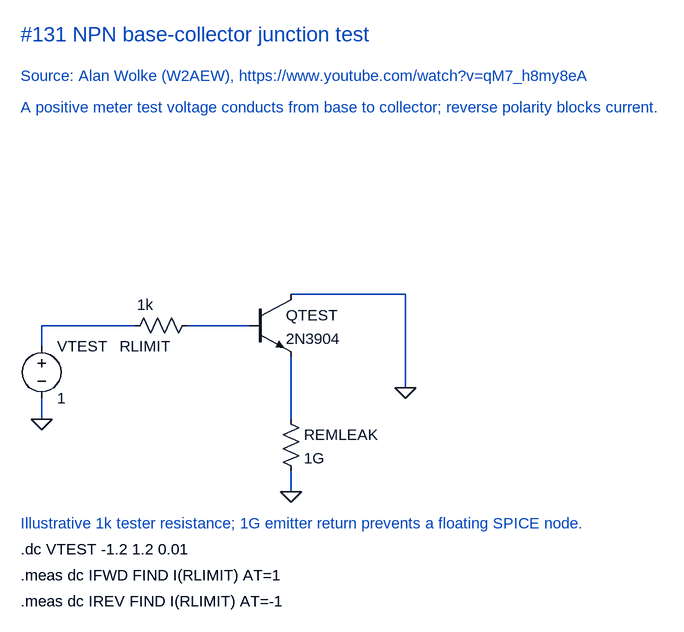
[diagram p0: schematic NPN base-collector test.asc]
NPN base-collector test.asc, the LTspice schematic file:
Version 4.1
SHEET 1 1148 960
WIRE 656 432 480 432
WIRE 240 480 96 480
WIRE 336 480 320 480
WIRE 416 480 336 480
WIRE 96 512 96 480
WIRE 656 576 656 432
WIRE 96 624 96 592
WIRE 480 624 480 528
WIRE 480 736 480 704
FLAG 96 624 0
FLAG 656 576 0
FLAG 480 736 0
SYMBOL voltage 96 496 R0
SYMATTR InstName VTEST
SYMATTR Value 1
SYMBOL res 224 496 R270
WINDOW 0 0 32 VBottom 2
WINDOW 3 32 32 VTop 2
SYMATTR InstName RLIMIT
SYMATTR Value 1k
SYMBOL npn 416 432 R0
SYMATTR InstName QTEST
SYMATTR Value 2N3904
SYMBOL res 464 608 R0
SYMATTR InstName REMLEAK
SYMATTR Value 1G
TEXT 64 32 Left 3 ;#131 NPN base-collector junction test
TEXT 64 96 Left 2 ;Source: Alan Wolke (W2AEW), https://www.youtube.com/watch?v=qM7_h8my8eA
TEXT 64 144 Left 2 ;A positive meter test voltage conducts from base to collector; reverse polarity blocks current.
TEXT 64 784 Left 2 ;Illustrative 1k tester resistance; 1G emitter return prevents a floating SPICE node.
TEXT 64 824 Left 2 !.dc VTEST -1.2 1.2 0.01
TEXT 64 864 Left 2 !.meas dc IFWD FIND I(RLIMIT) AT=1
TEXT 64 904 Left 2 !.meas dc IREV FIND I(RLIMIT) AT=-1

The netlist it stands for:
* NPN base-collector test.asc
VTEST N001 0 1
RLIMIT N001 N002 1k
QTEST 0 N002 N003 0 2N3904
REMLEAK N003 0 1G
.model NPN NPN
.model PNP PNP
.lib standard.bjt
* #131 NPN base-collector junction test
* Source: Alan Wolke (W2AEW), https://www.youtube.com/watch?v=qM7_h8my8eA
* A positive meter test voltage conducts from base to collector; reverse polarity blocks current.
* Illustrative 1k tester resistance; 1G emitter return prevents a floating SPICE node.
.dc VTEST -1.2 1.2 0.01
.meas dc IFWD FIND I(RLIMIT) AT=1
.meas dc IREV FIND I(RLIMIT) AT=-1
.backanno
.end